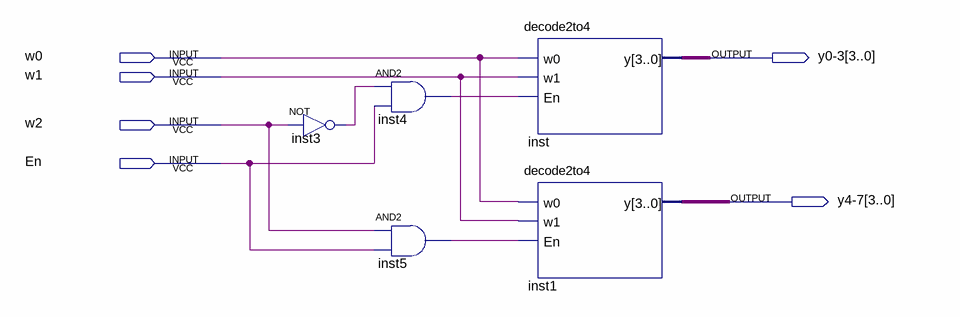
[diagram p0: schematic sheet]
// Quartus schematic 3_8decode.bdf as structural Verilog: 5 symbols, 6 pins
module \3_8decode  (
  input  w0,
  input  w1,
  input  w2,
  input  En,
  output [3:0] \y0-3 ,
  output [3:0] \y4-7 
);

  wire inst3_out, inst4_out, inst5_out;

  not inst3 (inst3_out, w2);
  and inst4 (inst4_out, inst3_out, En);
  and inst5 (inst5_out, w2, En);
  decode2to4 inst (.w0(w0), .w1(w1), .En(inst4_out), .y(\y0-3 ));
  decode2to4 inst1 (.w0(w0), .w1(w1), .En(inst5_out), .y(\y4-7 ));
endmodule
